# EAGLE schematic kicker (EAGLE 9.1.3)
DDRAWN: 08/12/18; FINISH: HASL; MATERIAL: FR-4; NDRAWN: WS; REV: 3.0; SCALE: 1:1; TITLE: SSL Kicker

## Sheet 1 of 8: Power Distribution
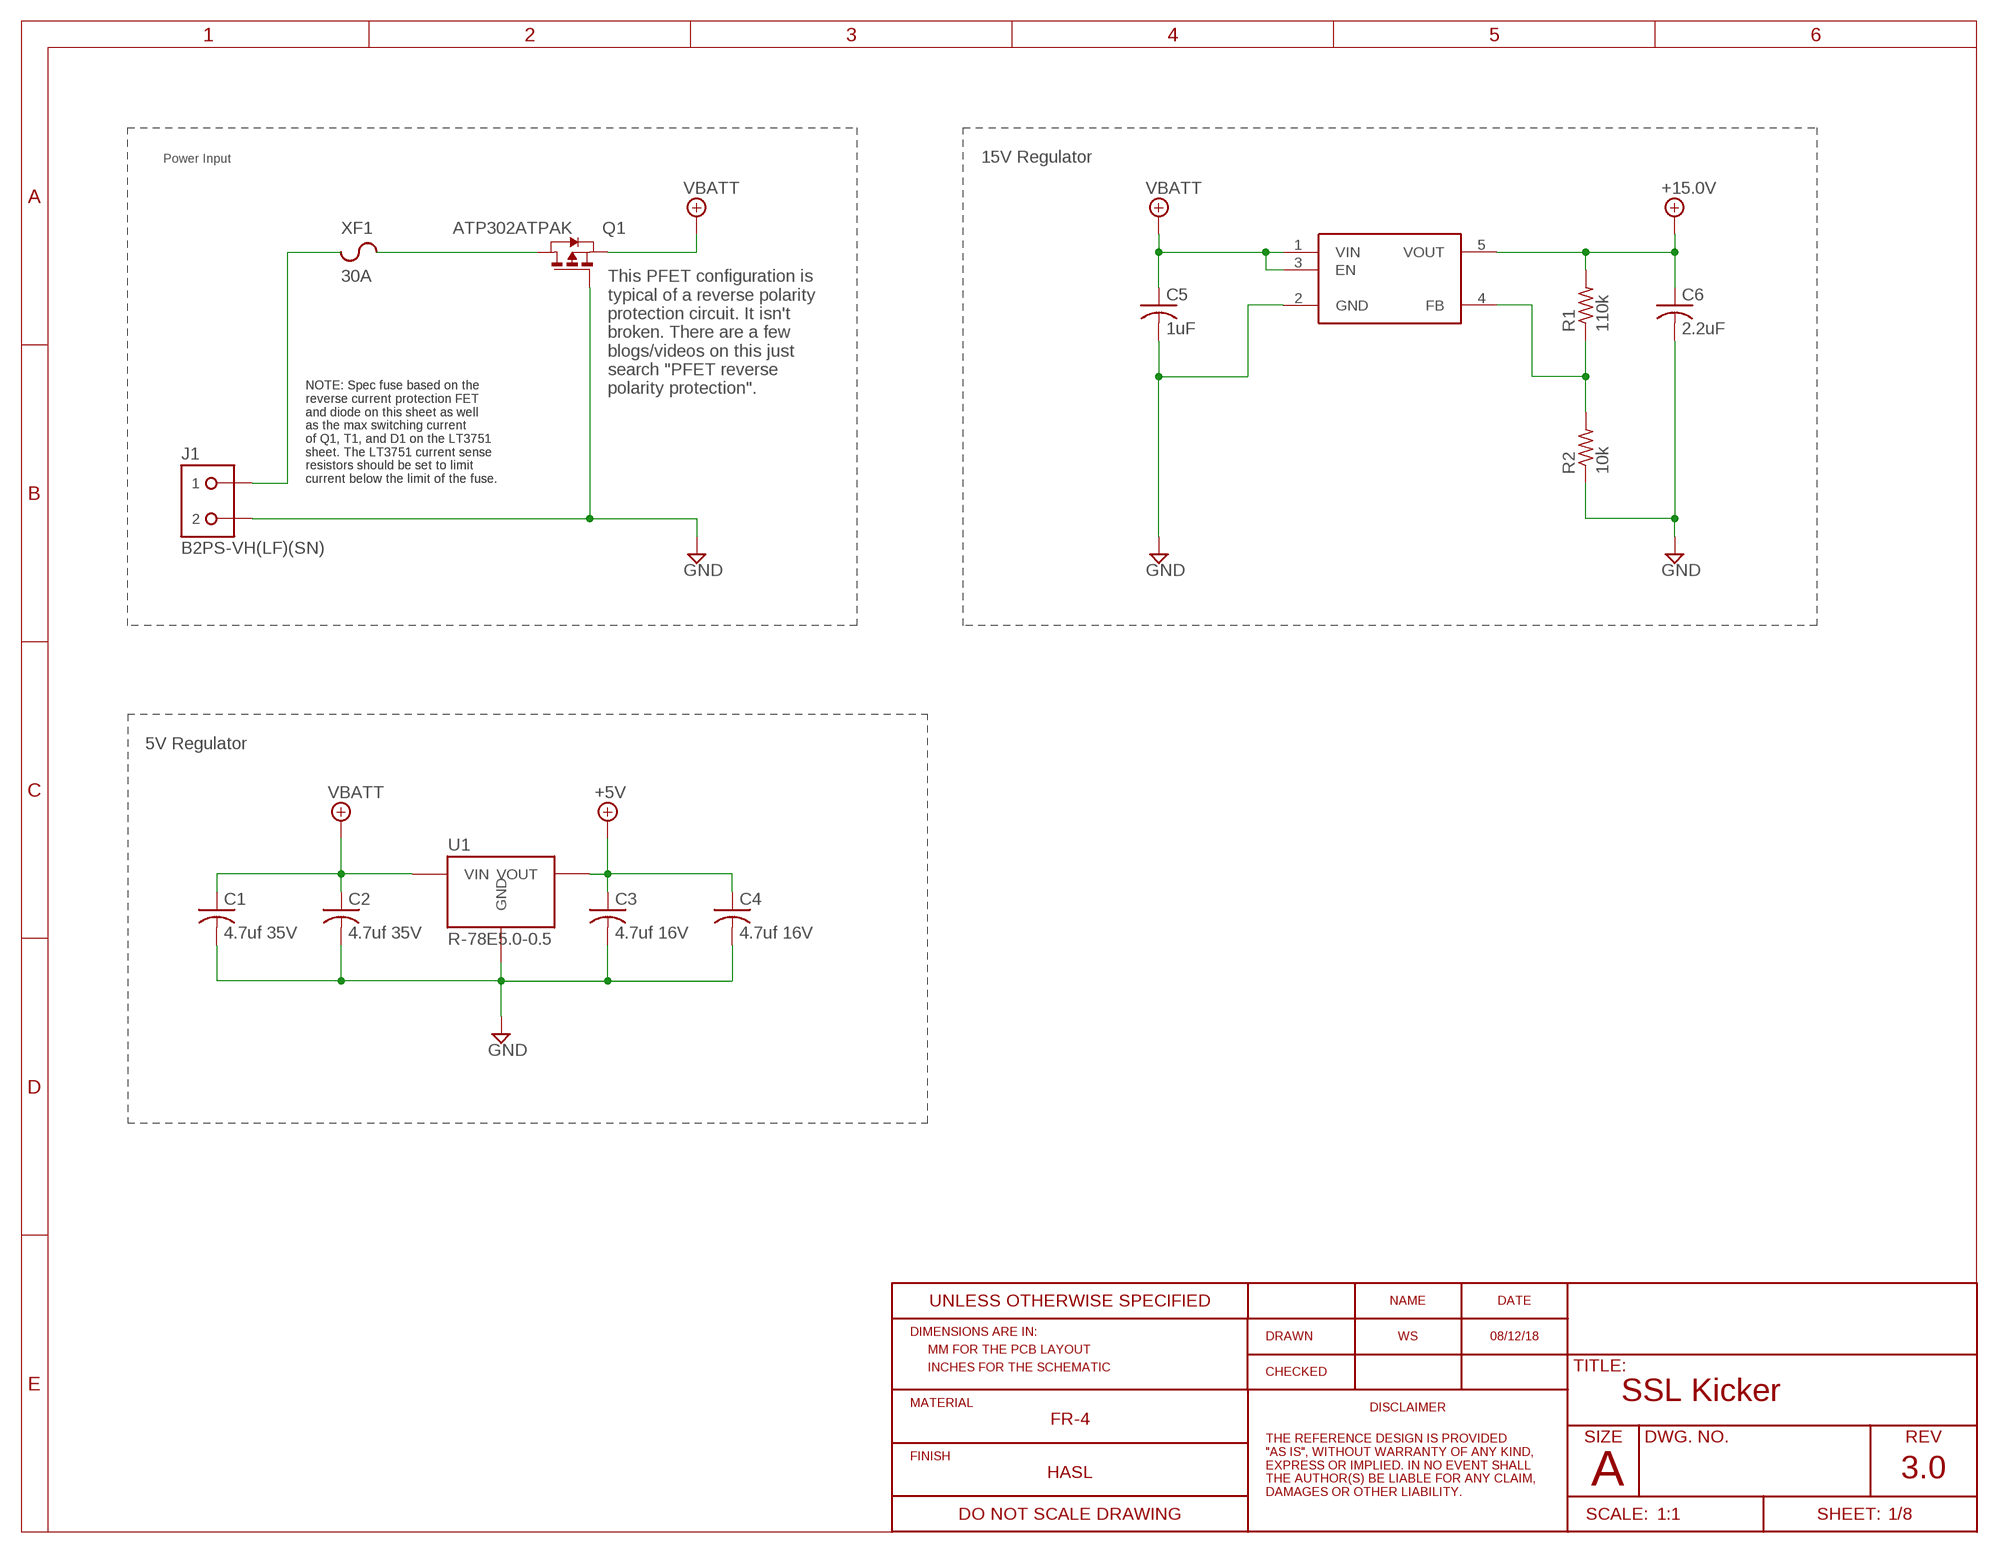
[diagram p0: schematic, sheet 1]

### Parts
C1  4.7uf 35V  C-USC1210  [C1210]
C2  4.7uf 35V  C-USC1210  [C1210]
C3  4.7uf 16V  C-USC1210  [C1210]
C4  4.7uf 16V  C-USC1210  [C1210]
C5  1uF  C-USC0603  [C0603]
C6  2.2uF  C-USC0603  [C0603]
J1  B2PS-VH(LF)(SN)  [B2PS-CENTERED]
Q1  ATP302ATPAK  [TO460P950X150-3]
R1  110k  R-US_R0603  [R0603]
R2  10k  R-US_R0603  [R0603]
U1  R-78E5.0-0.5  [R-78E]
U2  15V  MIC5235YM5SOT-23-5  [SOT95P280X145-5]
XF1  30A  3557-2  [3557-2]

### Nets
+5V: C3.1 C4.1 U1.3(VOUT) ; also sheet 3,5,6,7
+15.0V: C6.1 R1.2 U2.5(VOUT) ; also sheet 3,5
GND: C1.2 C2.2 C3.2 C4.2 C5.2 C6.2 J1.2 Q1.1(G) R2.1 U1.2(GND) U2.2(GND) ; also sheet 2,3,4,5,6,7
N$9: Q1.3(D) XF1.3 XF1.4
N$16: R1.1 R2.2 U2.4(FB)
N$39: J1.1 XF1.1 XF1.2
VBATT: C1.1 C2.1 C5.1 Q1.2(S) U1.1(VIN) U2.1(VIN) U2.3(EN) ; also sheet 2,4

### Notes on the sheet
- Power Input | 15V Regulator
- This PFET configuration is 
  typical of a reverse polarity 
  protection circuit. It isn't 
  broken. There are a few 
  blogs/videos on this just 
  search "PFET reverse 
  polarity protection".
- NOTE: Spec fuse based on the
  reverse current protection FET
  and diode on this sheet as well
  as the max switching current
  of Q1, T1, and D1 on the LT3751
  sheet. The LT3751 current sense
  resistors should be set to limit
  current below the limit of the fuse.
- NOTE: Spec fuse based on the
  reverse current protection FET
  and diode on this sheet as well
  as the max switching current
  of Q1, T1, and D1 on the LT3751
  sheet. The LT3751 current sense
  resistors should be set to limit
  current below the limit of the fuse.
- 5V Regulator

## Sheet 2 of 8: High Voltage Converter
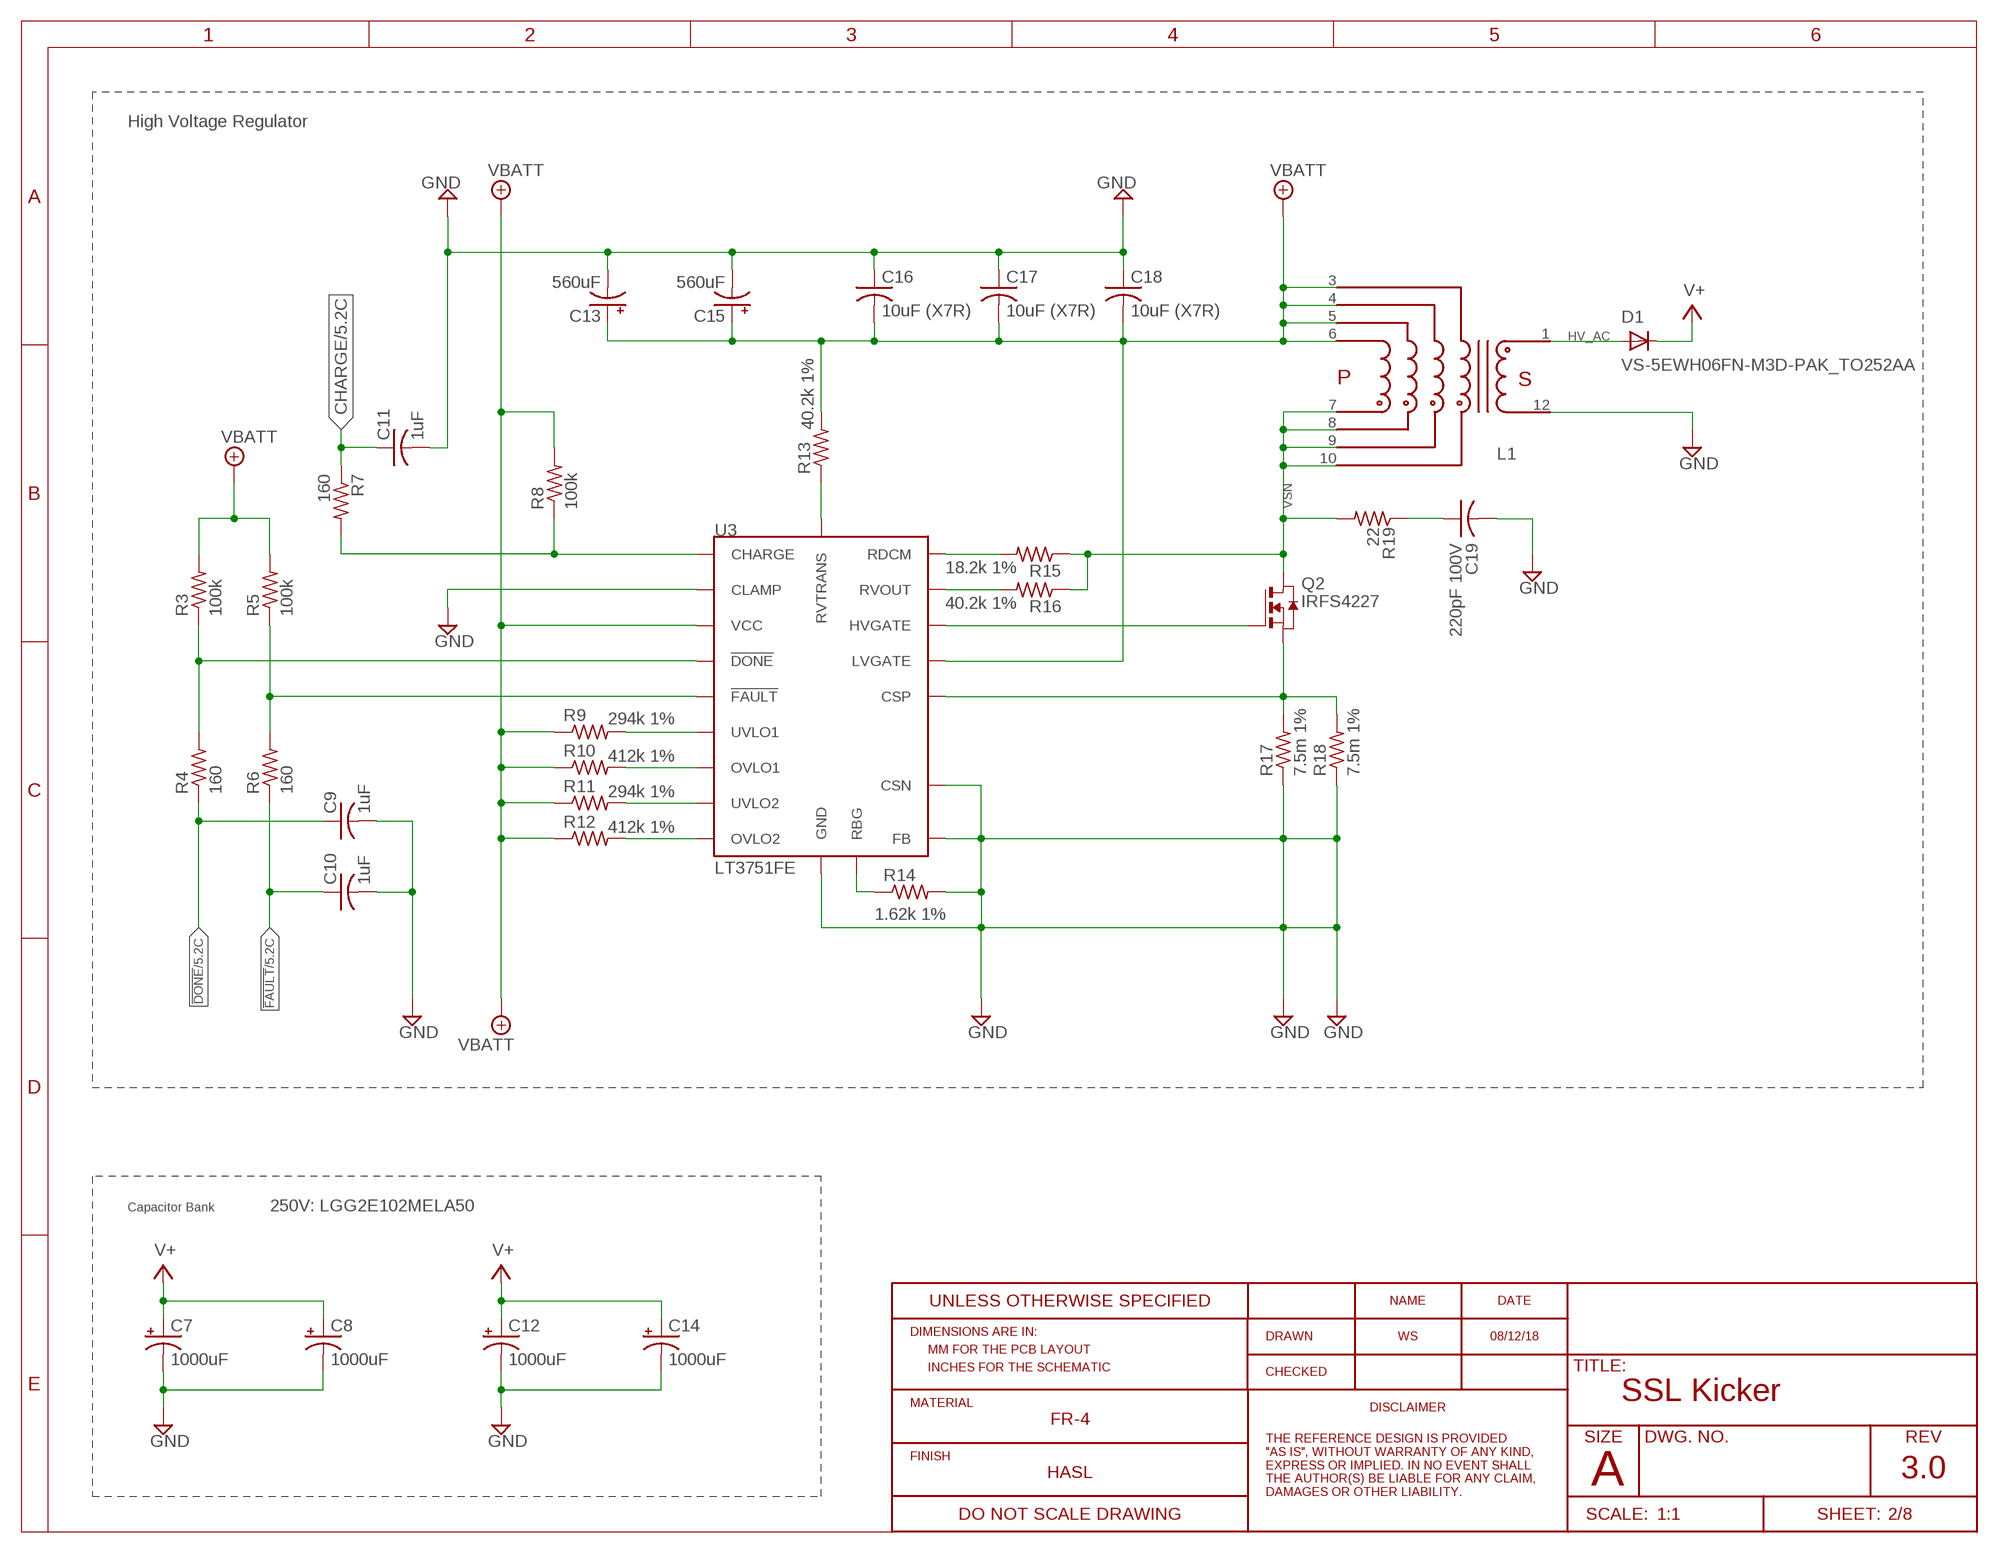
[diagram p1: schematic, sheet 2]

### Parts
C7  1000uF  CPOL-USE10-25  [EB25D]
C8  1000uF  CPOL-USE10-25  [EB25D]
C9  1uF  C-USC0603  [C0603]
C10  1uF  C-USC0603  [C0603]
C11  1uF  C-USC0603  [C0603]
C12  1000uF  CPOL-USE10-25  [EB25D]
C13  560uF  CPOL-USE7.5-18  [E7,5-18]
C14  1000uF  CPOL-USE10-25  [EB25D]
C15  560uF  CPOL-USE7.5-18  [E7,5-18]
C16  10uF (X7R)  C-USC1210  [C1210]
C17  10uF (X7R)  C-USC1210  [C1210]
C18  10uF (X7R)  C-USC1210  [C1210]
C19  220pF 100V  C-USC0603  [C0603]
D1  VS-5EWH06FN-M3D-PAK_TO252AA  [TO460P990X239-3]
L1  GA34XX-BLBL  [SOP400P3370X1400-12]
Q2  IRFS4227  [D2PAK]
R3  100k  R-US_R0603  [R0603]
R4  160  R-US_R0603  [R0603]
R5  100k  R-US_R0603  [R0603]
R6  160  R-US_R0603  [R0603]
R7  160  R-US_R0603  [R0603]
R8  100k  R-US_R0603  [R0603]
R9  294k 1%  R-US_R0805  [R0805]
R10  412k 1%  R-US_R0805  [R0805]
R11  294k 1%  R-US_R0805  [R0805]
R12  412k 1%  R-US_R0805  [R0805]
R13  40.2k 1%  R-US_R0805  [R0805]
R14  1.62k 1%  R-US_R0805  [R0805]
R15  18.2k 1%  R-US_R0805  [R0805]
R16  40.2k 1%  R-US_R0805  [R0805]
R17  7.5m 1%  R-US_R2512  [R2512]
R18  7.5m 1%  R-US_R2512  [R2512]
R19  22  R-US_R0805  [R0805]
U3  LT3751FE  [TSSOP-20_EP]

### Nets
!DONE!: C9.1 R4.1 ; also sheet 5
!DONE_LPF: R3.1 R4.2 U3.7(!DONE) ; also sheet 3
!FAULT!: C10.1 R6.1 ; also sheet 5
!FAULT_LPF: R5.1 R6.2 U3.6(!FAULT) ; also sheet 3
CHARGE: C11.1 R7.1 ; also sheet 5
CHARGE_LPF: R7.2 R8.1 U3.8(CHARGE)
GND: C7.- C8.- C9.2 C10.2 C11.2 C12.- C13.- C14.- C15.- C16.1 C17.1 C18.1 C19.2 L1.12 R14.2 R17.1 R18.1 U3.9(CLAMP) U3.10(FB) U3.11(CSN) U3.PAD(GND) ; also sheet 1,3,4,5,6,7
HV_AC: D1.2(A) L1.1
HVGATE: Q2.1(G) U3.15(HVGATE)
N$1: R14.1 U3.16(RBG)
N$24: R13.1 U3.1(RVTRANS)
N$32: C19.1 R19.1
OVLO1: R10.2 U3.3(OVLO1)
OVLO2: R12.2 U3.5(OVLO2)
RDCM: R15.2 U3.20(RDCM)
RVOUT: R16.2 U3.18(RVOUT)
SENSE: Q2.3(S) R17.2 R18.2 U3.12(CSP)
UVLO1: R9.2 U3.2(UVLO1)
UVLO2: R11.2 U3.4(UVLO2)
V+: C7.+ C8.+ C12.+ C14.+ D1.3(C) ; also sheet 3,4,5
VBATT: C13.+ C15.+ C16.2 C17.2 C18.2 L1.3 L1.4 L1.5 L1.6 R3.2 R5.2 R8.2 R9.1 R10.1 R11.1 R12.1 R13.2 U3.13(VCC) U3.14(LVGATE) ; also sheet 1,4
VSN: L1.7 L1.8 L1.9 L1.10 Q2.2(D) R15.1 R16.1 R19.2

### Notes on the sheet
- High Voltage Regulator
- Capacitor Bank | 250V: LGG2E102MELA50

## Sheet 3 of 8: LED Indicators
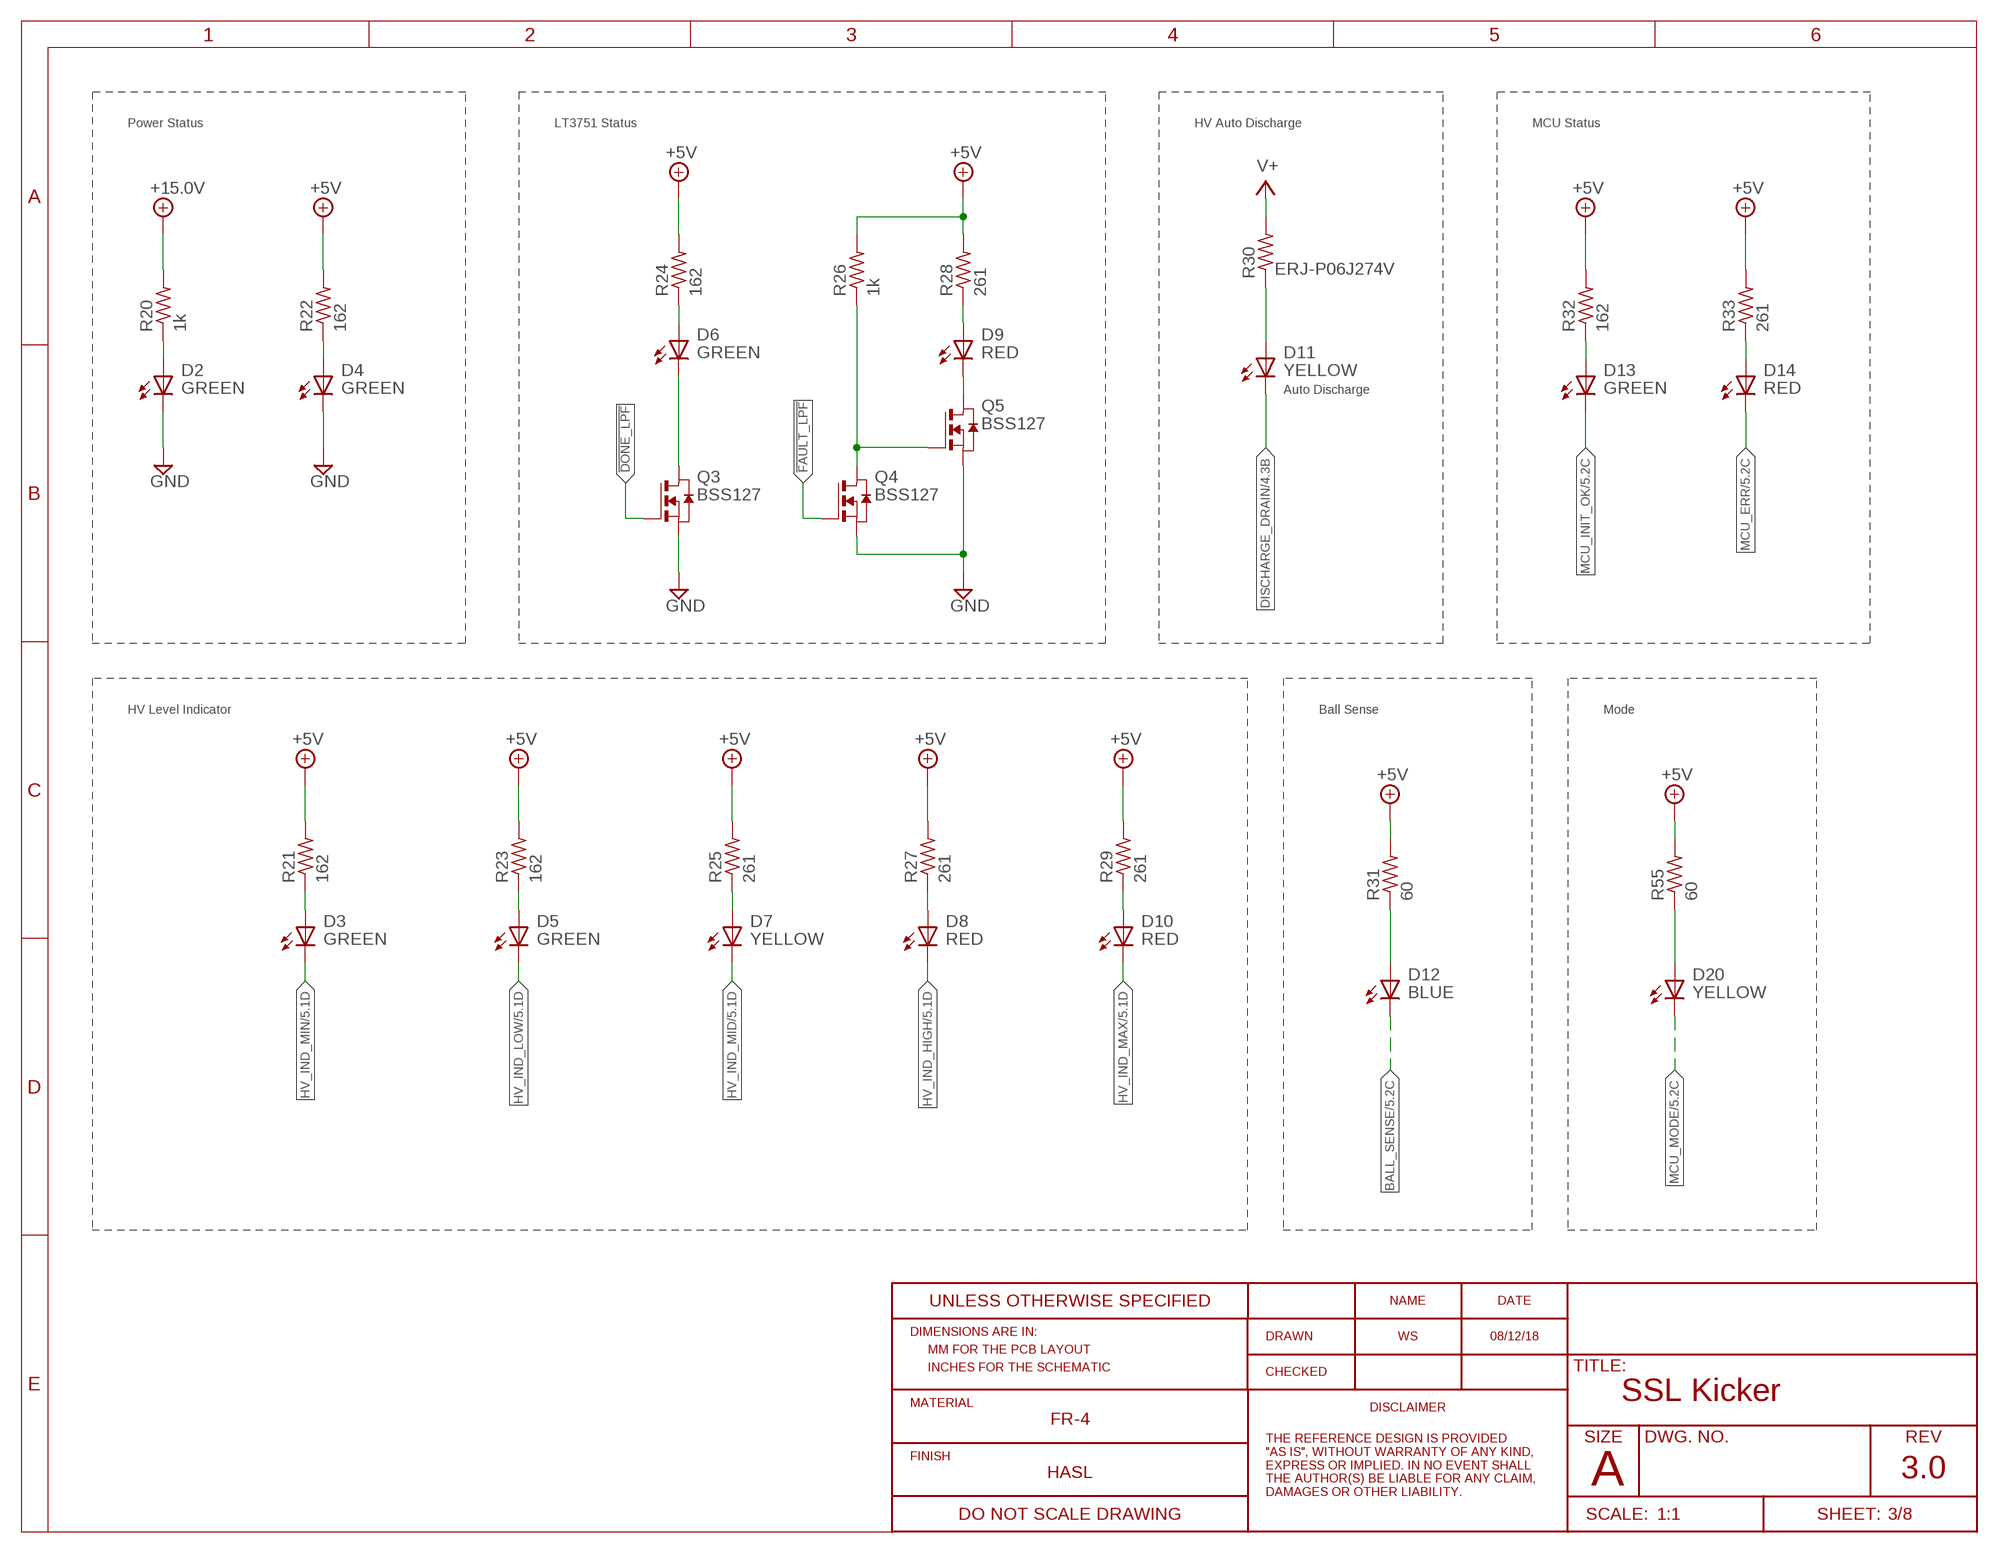
[diagram p2: schematic, sheet 3]

### Parts
D2  GREEN  LED-SMD-GREEN  [CHIP-LED0603]
D3  GREEN  LED-SMD-GREEN  [CHIP-LED0603]
D4  GREEN  LED-SMD-GREEN  [CHIP-LED0603]
D5  GREEN  LED-SMD-GREEN  [CHIP-LED0603]
D6  GREEN  LED-SMD-GREEN  [CHIP-LED0603]
D7  YELLOW  LED-SMD-YELLOW  [CHIP-LED0603]
D8  RED  LED-SMD-RED  [CHIP-LED0603]
D9  RED  LED-SMD-RED  [CHIP-LED0603]
D10  RED  LED-SMD-RED  [CHIP-LED0603]
D11  YELLOW  LED-SMD-YELLOW  [CHIP-LED0603]
D12  BLUE  LED-SMD-BLUE  [CHIP-LED0603]
D13  GREEN  LED-SMD-GREEN  [CHIP-LED0603]
D14  RED  LED-SMD-RED  [CHIP-LED0603]
D20  YELLOW  LED-SMD-YELLOW  [CHIP-LED0603]
Q3  BSS127  [SOT-23-3]
Q4  BSS127  [SOT-23-3]
Q5  BSS127  [SOT-23-3]
R20  1k  R-US_R0603  [R0603]
R21  162  R-US_R0603  [R0603]
R22  162  R-US_R0603  [R0603]
R23  162  R-US_R0603  [R0603]
R24  162  R-US_R0603  [R0603]
R25  261  R-US_R0603  [R0603]
R26  1k  R-US_R0603  [R0603]
R27  261  R-US_R0603  [R0603]
R28  261  R-US_R0603  [R0603]
R29  261  R-US_R0603  [R0603]
R30  ERJ-P06J274V  R-US_R0805  [R0805]
R31  60  R-US_R0603  [R0603]
R32  162  R-US_R0603  [R0603]
R33  261  R-US_R0603  [R0603]
R55  60  R-US_R0603  [R0603]

### Nets
!DONE_LPF: Q3.1(G) ; also sheet 2
!FAULT_LPF: Q4.1(G) ; also sheet 2
+5V: R21.2 R22.2 R23.2 R24.2 R25.2 R26.2 R27.2 R28.2 R29.2 R31.2 R32.2 R33.2 R55.2 ; also sheet 1,5,6,7
+15.0V: R20.2 ; also sheet 1,5
BALL_SENSE: D12.C(K) ; also sheet 5
DISCHARGE_DRAIN: D11.C(K) ; also sheet 4
GND: D2.C(K) D4.C(K) Q3.2(S) Q4.2(S) Q5.2(S) ; also sheet 1,2,4,5,6,7
HV_IND_HIGH: D8.C(K) ; also sheet 5
HV_IND_LOW: D5.C(K) ; also sheet 5
HV_IND_MAX: D10.C(K) ; also sheet 5
HV_IND_MID: D7.C(K) ; also sheet 5
HV_IND_MIN: D3.C(K) ; also sheet 5
MCU_ERR: D14.C(K) ; also sheet 5
MCU_INIT_OK: D13.C(K) ; also sheet 5
MCU_MODE: D20.C(K) ; also sheet 5
N$3: D14.A R33.1
N$4: D13.A R32.1
N$5: D6.A R24.1
N$11: D3.A R21.1
N$12: D5.A R23.1
N$13: D7.A R25.1
N$17: D20.A R55.1
N$20: D4.A R22.1
N$21: D8.A R27.1
N$22: D2.A R20.1
N$26: Q4.3(D) Q5.1(G) R26.1
N$27: D9.A R28.1
N$28: D9.C(K) Q5.3(D)
N$29: D11.A R30.1
N$30: D10.A R29.1
N$37: D6.C(K) Q3.3(D)
N$40: D12.A R31.1
V+: R30.2 ; also sheet 2,4,5

### Notes on the sheet
- Power Status | LT3751 Status | HV Auto Discharge | MCU Status
- Auto Discharge
- HV Level Indicator | Ball Sense | Mode

## Sheet 4 of 8: Auto Quick Discharge
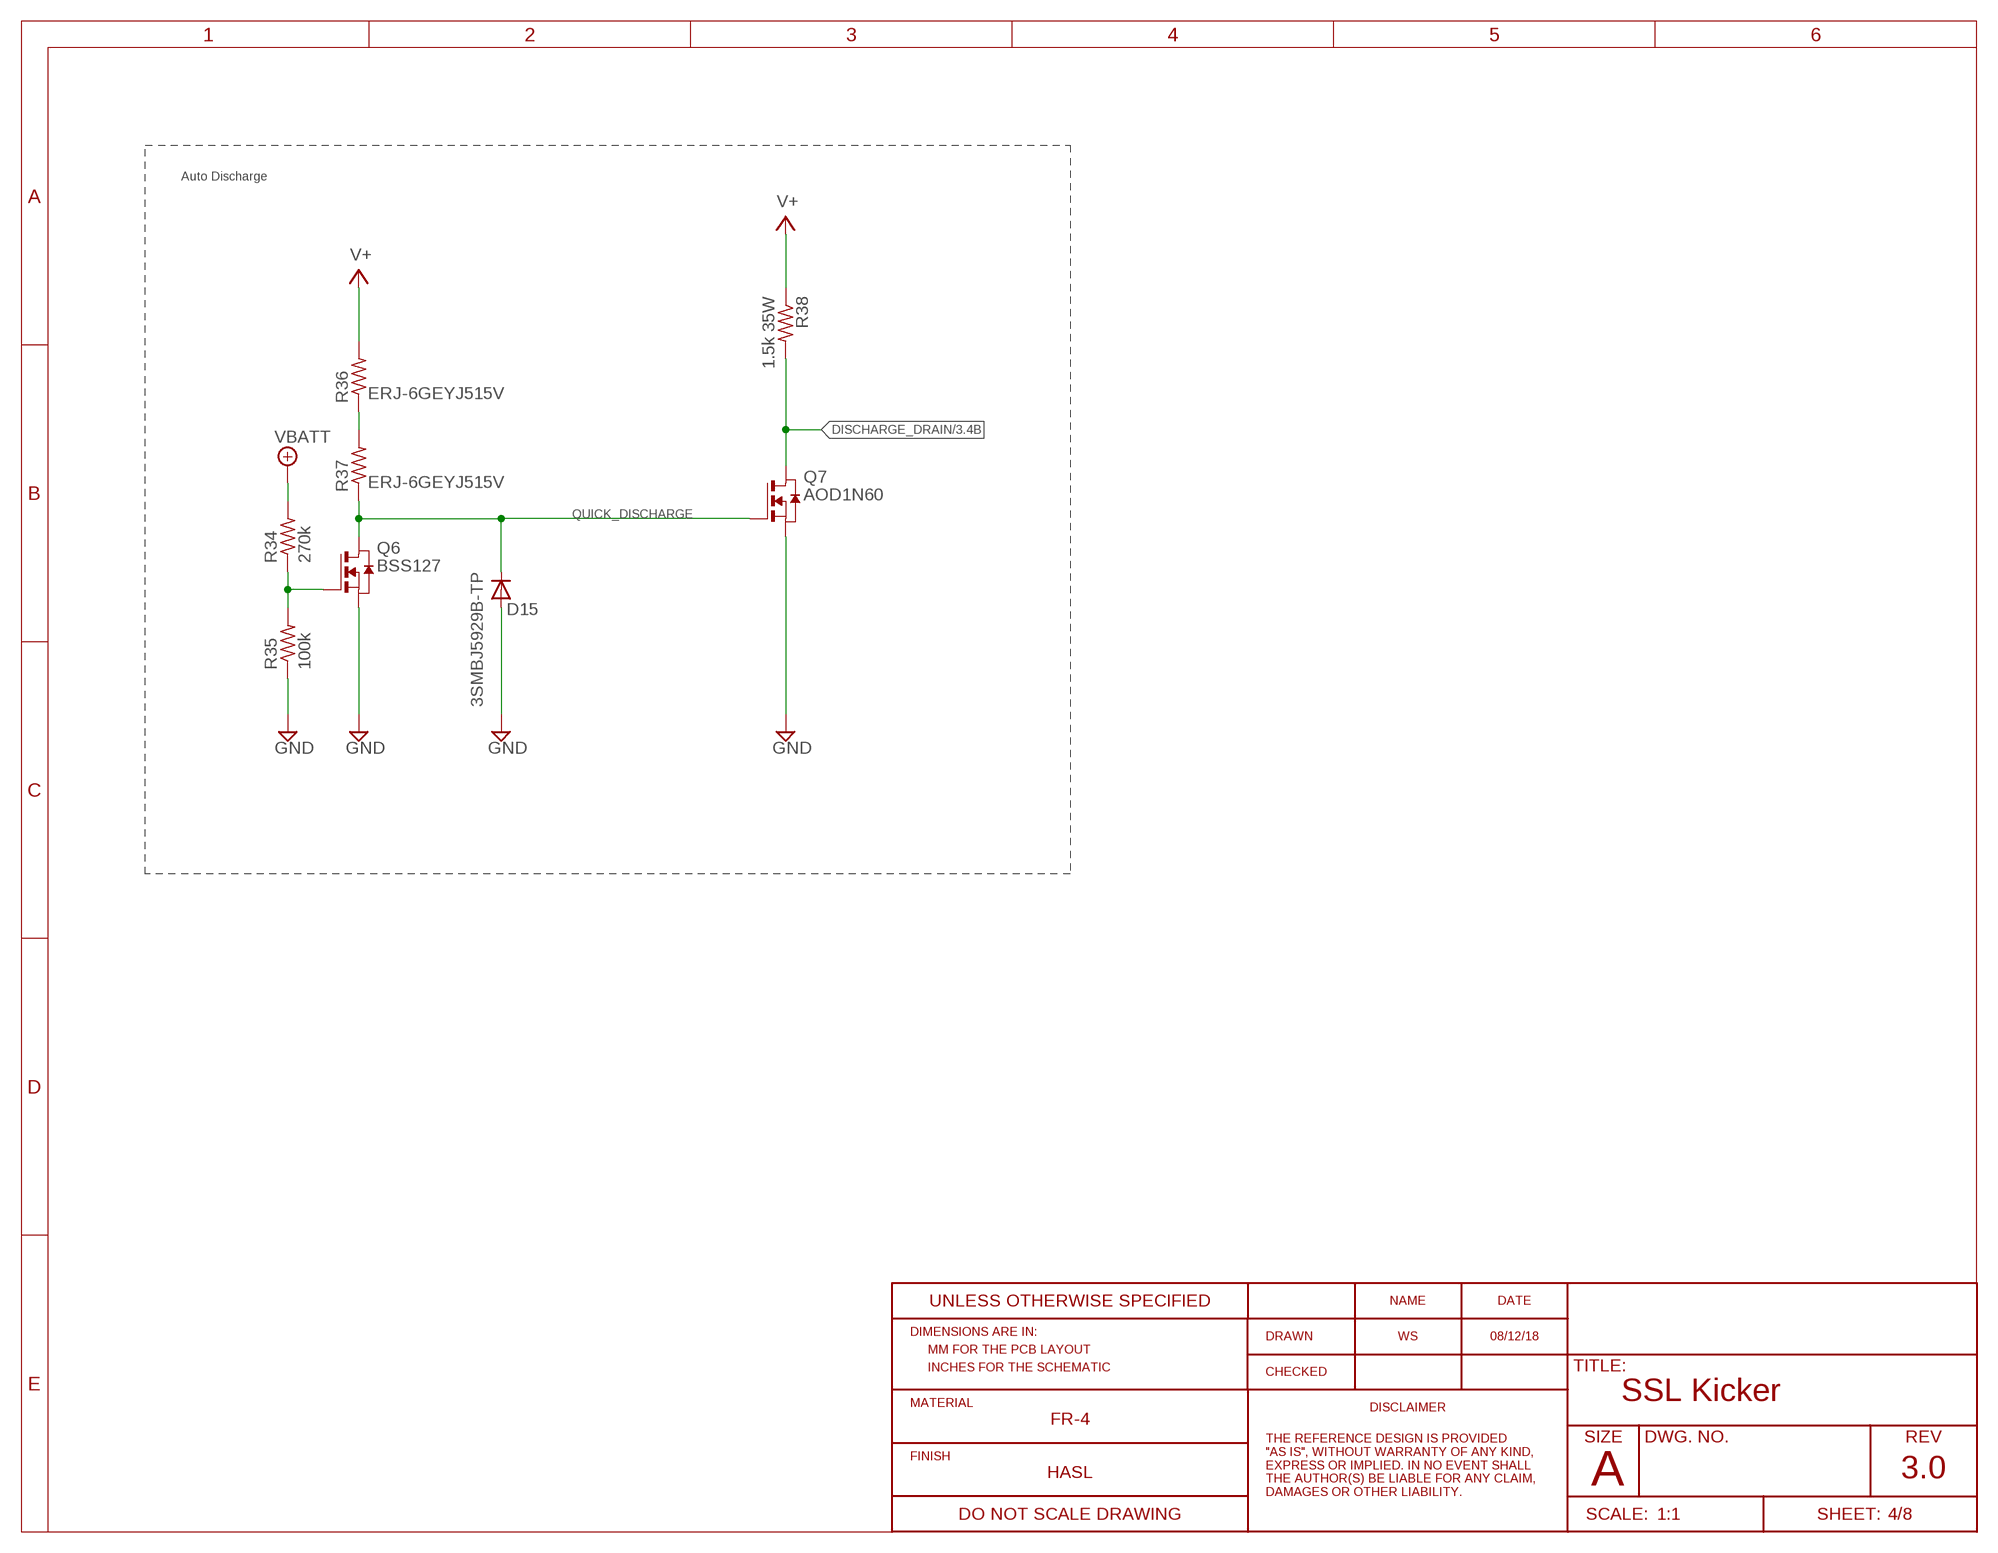
[diagram p3: schematic, sheet 4]

### Parts
D15  3SMBJ5929B-TP  DIODE-DO214AA  [DO214AA]
Q6  BSS127  [SOT-23-3]
Q7  AOD1N60  [DPAK]
R34  270k  R-US_R0603  [R0603]
R35  100k  R-US_R0603  [R0603]
R36  ERJ-6GEYJ515V  R-US_R0805  [R0805]
R37  ERJ-6GEYJ515V  R-US_R0805  [R0805]
R38  1.5k 35W  PWR263S-35TO-263AB  [TO508P1539X450-3]

### Nets
DISCHARGE_DRAIN: Q7.FIN(D) R38.2(PIN2) ; also sheet 3
GND: D15.A Q6.2(S) Q7.3(S) R35.1 ; also sheet 1,2,3,5,6,7
N$2: R36.1 R37.2
N$10: Q6.1(G) R34.1 R35.2
QUICK_DISCHARGE: D15.C Q6.3(D) Q7.1(G) R37.1
V+: R36.2 R38.1(PIN1) ; also sheet 2,3,5
VBATT: R34.2 ; also sheet 1,2

### Notes on the sheet
- Auto Discharge

## Sheet 5 of 8: MCU
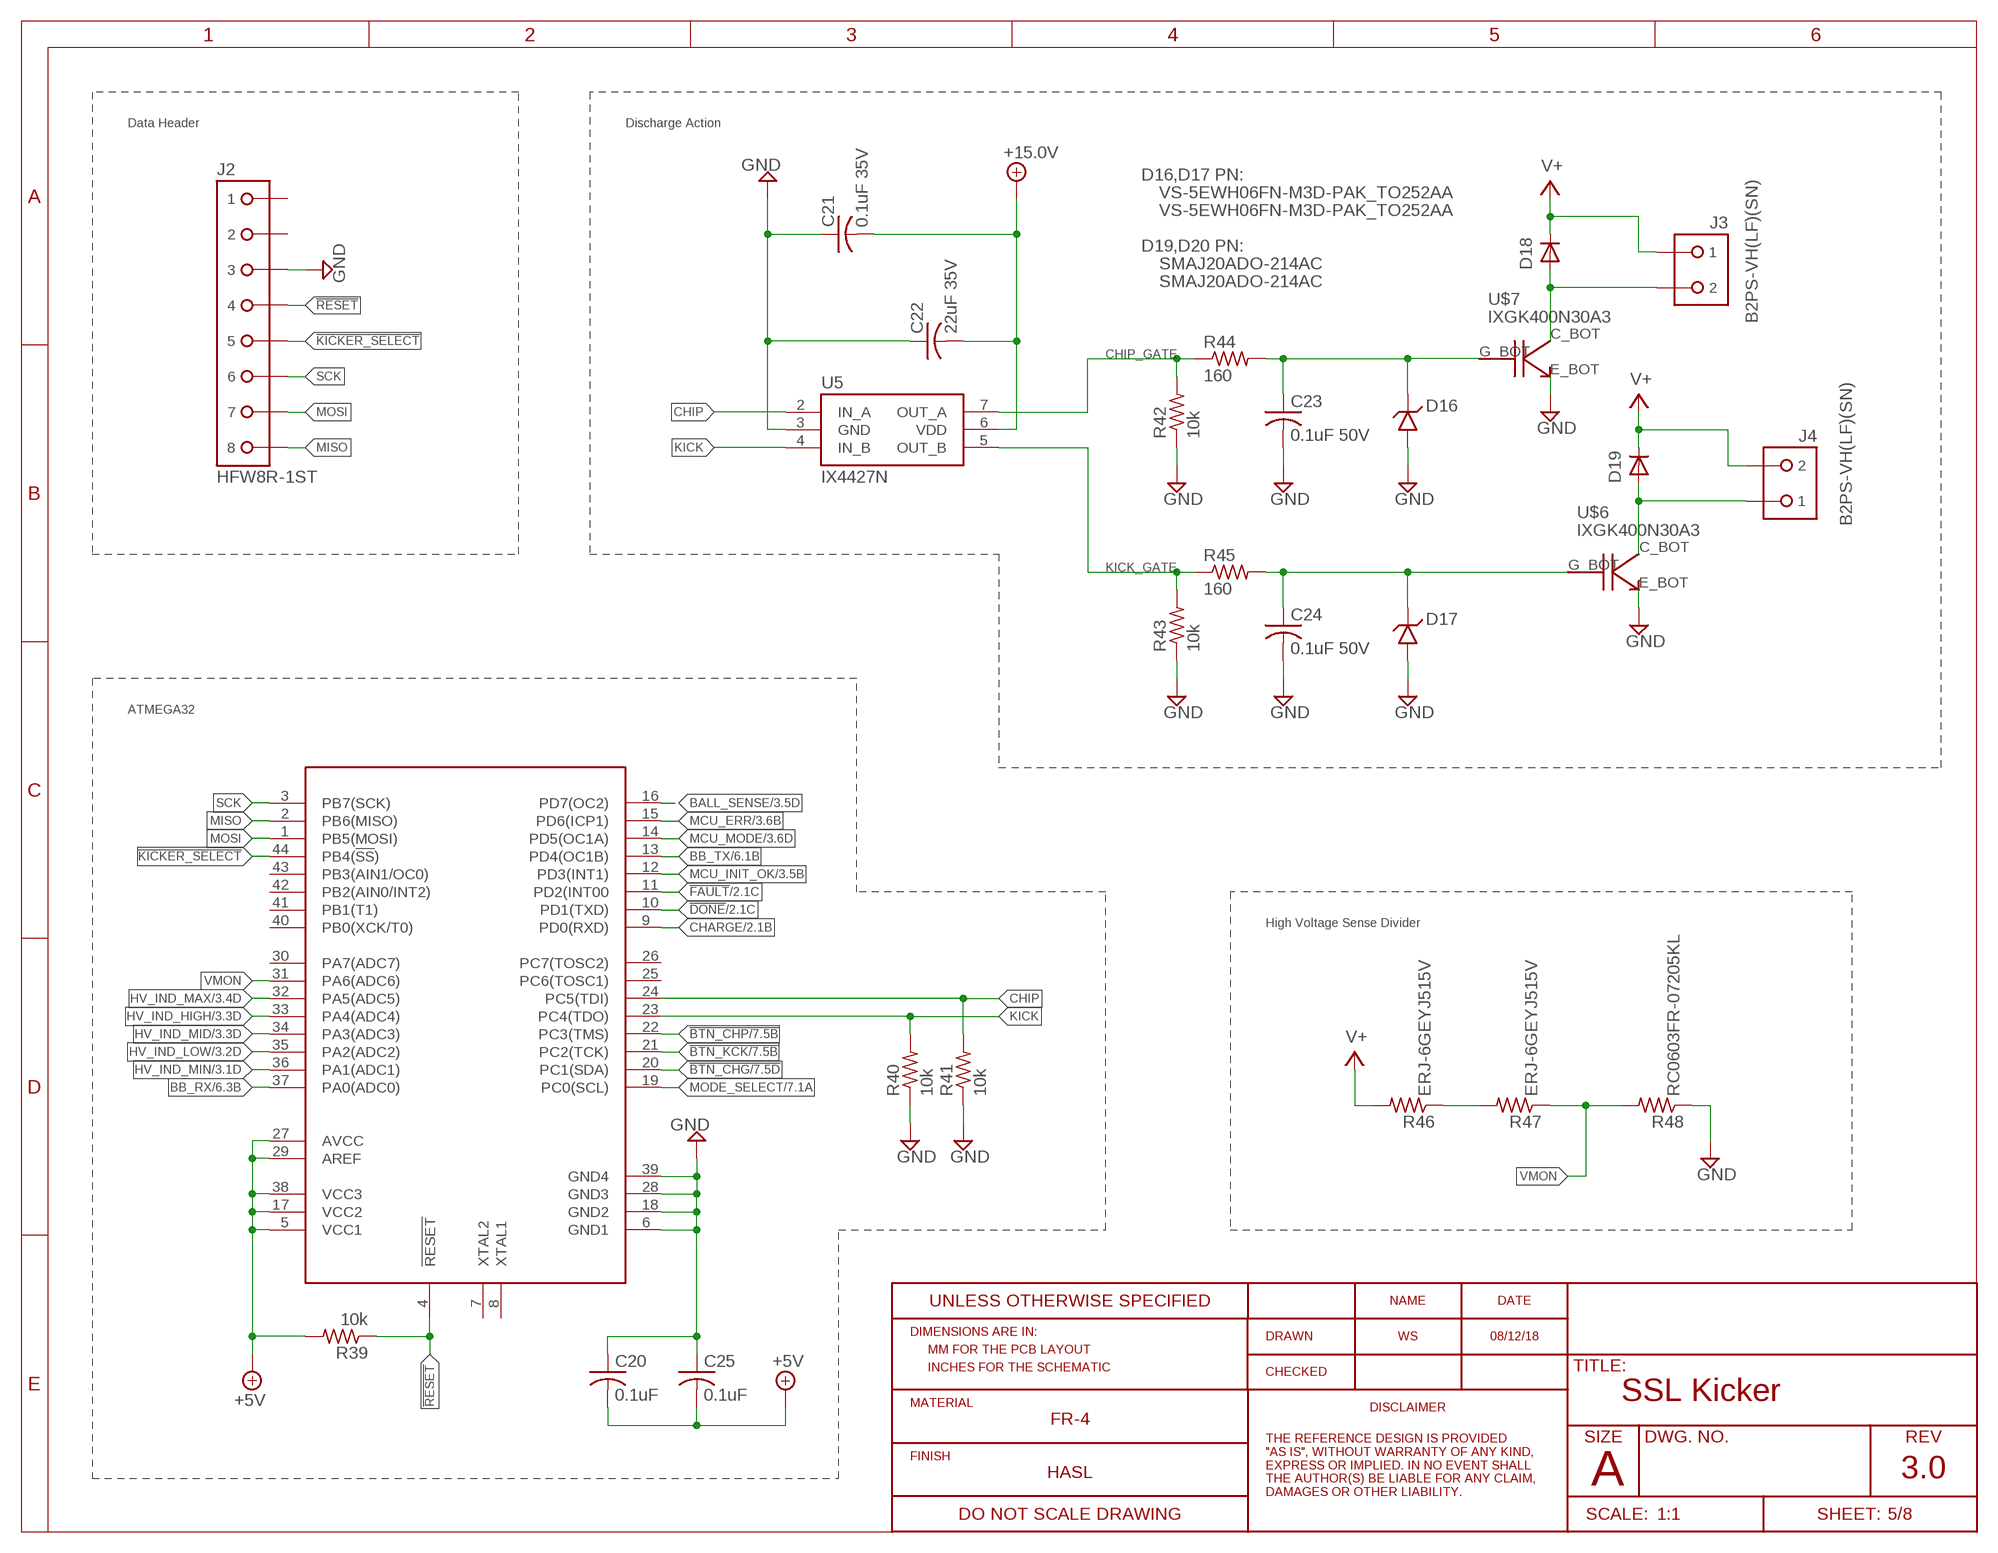
[diagram p4: schematic, sheet 5]

### Parts
C20  0.1uF  C-USC0603  [C0603]
C21  0.1uF 35V  C-USC0603  [C0603]
C22  22uF 35V  C-USC0805  [C0805]
C23  0.1uF 50V  C-USC0603  [C0603]
C24  0.1uF 50V  C-USC0603  [C0603]
C25  0.1uF  C-USC0603  [C0603]
D16  SMAJ20ADO-214AC  [RESM5226X262]
D17  SMAJ20ADO-214AC  [RESM5226X262]
D18  VS-5EWH06FN-M3D-PAK_TO252AA  [TO460P990X239-3]
D19  VS-5EWH06FN-M3D-PAK_TO252AA  [TO460P990X239-3]
J2  HFW8R-1ST  [HFW8R-1ST]
J3  B2PS-VH(LF)(SN)  [B2PS-CENTERED]
J4  B2PS-VH(LF)(SN)  [B2PS-CENTERED]
R39  10k  R-US_R0603  [R0603]
R40  10k  R-US_R0603  [R0603]
R41  10k  R-US_R0603  [R0603]
R42  10k  R-US_R0603  [R0603]
R43  10k  R-US_R0603  [R0603]
R44  160  R-US_R1206  [R1206]
R45  160  R-US_R1206  [R1206]
R46  ERJ-6GEYJ515V  R-US_R0805  [R0805]
R47  ERJ-6GEYJ515V  R-US_R0805  [R0805]
R48  RC0603FR-07205KL  R-US_R0603  [R0603]
U4  AT32ATQFP44  [QFP80P1200X1200X120-44]
U5  IX4427N  [SOIC-8]
U$6  IXGK400N30A3  [TO264]
U$7  IXGK400N30A3  [TO264]

### Nets
!BTN_CHG: U4.20(PC1(SDA)) ; also sheet 7
!BTN_CHP: U4.22(PC3(TMS)) ; also sheet 7
!BTN_KCK: U4.21(PC2(TCK)) ; also sheet 7
!DONE!: U4.10(PD1(TXD)) ; also sheet 2
!FAULT!: U4.11(PD2(INT00) ; also sheet 2
!KICKER_SELECT: J2.5 U4.44(PB4(!SS!))
!RESET: J2.4 R39.1 U4.4(!RESET!)
+5V: C20.2 C25.2 R39.2 U4.5(VCC1) U4.17(VCC2) U4.27(AVCC) U4.29(AREF) U4.38(VCC3) ; also sheet 1,3,6,7
+15.0V: C21.2 C22.2 U5.6(VDD) ; also sheet 1,3
BALL_SENSE: U4.16(PD7(OC2)) ; also sheet 3
BB_RX: U4.37(PA0(ADC0)) ; also sheet 6
BB_TX: U4.13(PD4(OC1B)) ; also sheet 6
CHARGE: U4.9(PD0(RXD)) ; also sheet 2
CHIP: R41.2 U4.24(PC5(TDI)) U5.2(IN_A)
CHIP_GATE: R42.2 R44.1 U5.7(OUT_A)
CHIPPER: D18.2(A) J3.2 U$7.C_BOT(C)
GND: C20.1 C21.1 C22.1 C23.2 C24.2 C25.1 D16.1(A) D17.1(A) J2.3 R40.1 R41.1 R42.1 R43.1 R48.1 U4.6(GND1) U4.18(GND2) U4.28(GND3) U4.39(GND4) U5.3(GND) U$6.E_BOT(E) U$7.E_BOT(E) ; also sheet 1,2,3,4,6,7
HV_IND_HIGH: U4.33(PA4(ADC4)) ; also sheet 3
HV_IND_LOW: U4.35(PA2(ADC2)) ; also sheet 3
HV_IND_MAX: U4.32(PA5(ADC5)) ; also sheet 3
HV_IND_MID: U4.34(PA3(ADC3)) ; also sheet 3
HV_IND_MIN: U4.36(PA1(ADC1)) ; also sheet 3
KICK: R40.2 U4.23(PC4(TDO)) U5.4(IN_B)
KICK_GATE: R43.2 R45.1 U5.5(OUT_B)
KICKER: D19.2(A) J4.1 U$6.C_BOT(C)
MCU_ERR: U4.15(PD6(ICP1)) ; also sheet 3
MCU_INIT_OK: U4.12(PD3(INT1)) ; also sheet 3
MCU_MODE: U4.14(PD5(OC1A)) ; also sheet 3
MISO: J2.8 U4.2(PB6(MISO))
MODE_SELECT: U4.19(PC0(SCL)) ; also sheet 7
MOSI: J2.7 U4.1(PB5(MOSI))
N$7: C23.1 D16.2(C) R44.2 U$7.G_BOT(G)
N$8: C24.1 D17.2(C) R45.2 U$6.G_BOT(G)
N$15: R46.1 R47.2
SCK: J2.6 U4.3(PB7(SCK))
V+: D18.3(C) D19.3(C) J3.1 J4.2 R46.2 ; also sheet 2,3,4
VMON: R47.1 R48.2 U4.31(PA6(ADC6))
Unconnected: J2.1 J2.2 J2.LEG1 J2.LEG2 U4.7(XTAL2) U4.8(XTAL1) U4.25(PC6(TOSC1)) U4.26(PC7(TOSC2)) U4.30(PA7(ADC7)) U4.40(PB0(XCK/T0)) U4.41(PB1(T1)) U4.42(PB2(AIN0/INT2)) U4.43(PB3(AIN1/OC0))

### Notes on the sheet
- Data Header | Discharge Action
- D16,D17 PN:
- VS-5EWH06FN-M3D-PAK_TO252AA
- VS-5EWH06FN-M3D-PAK_TO252AA
- D19,D20 PN:
- SMAJ20ADO-214AC
- SMAJ20ADO-214AC
- ATMEGA32
- High Voltage Sense Divider

## Sheet 6 of 8: Breakbeam
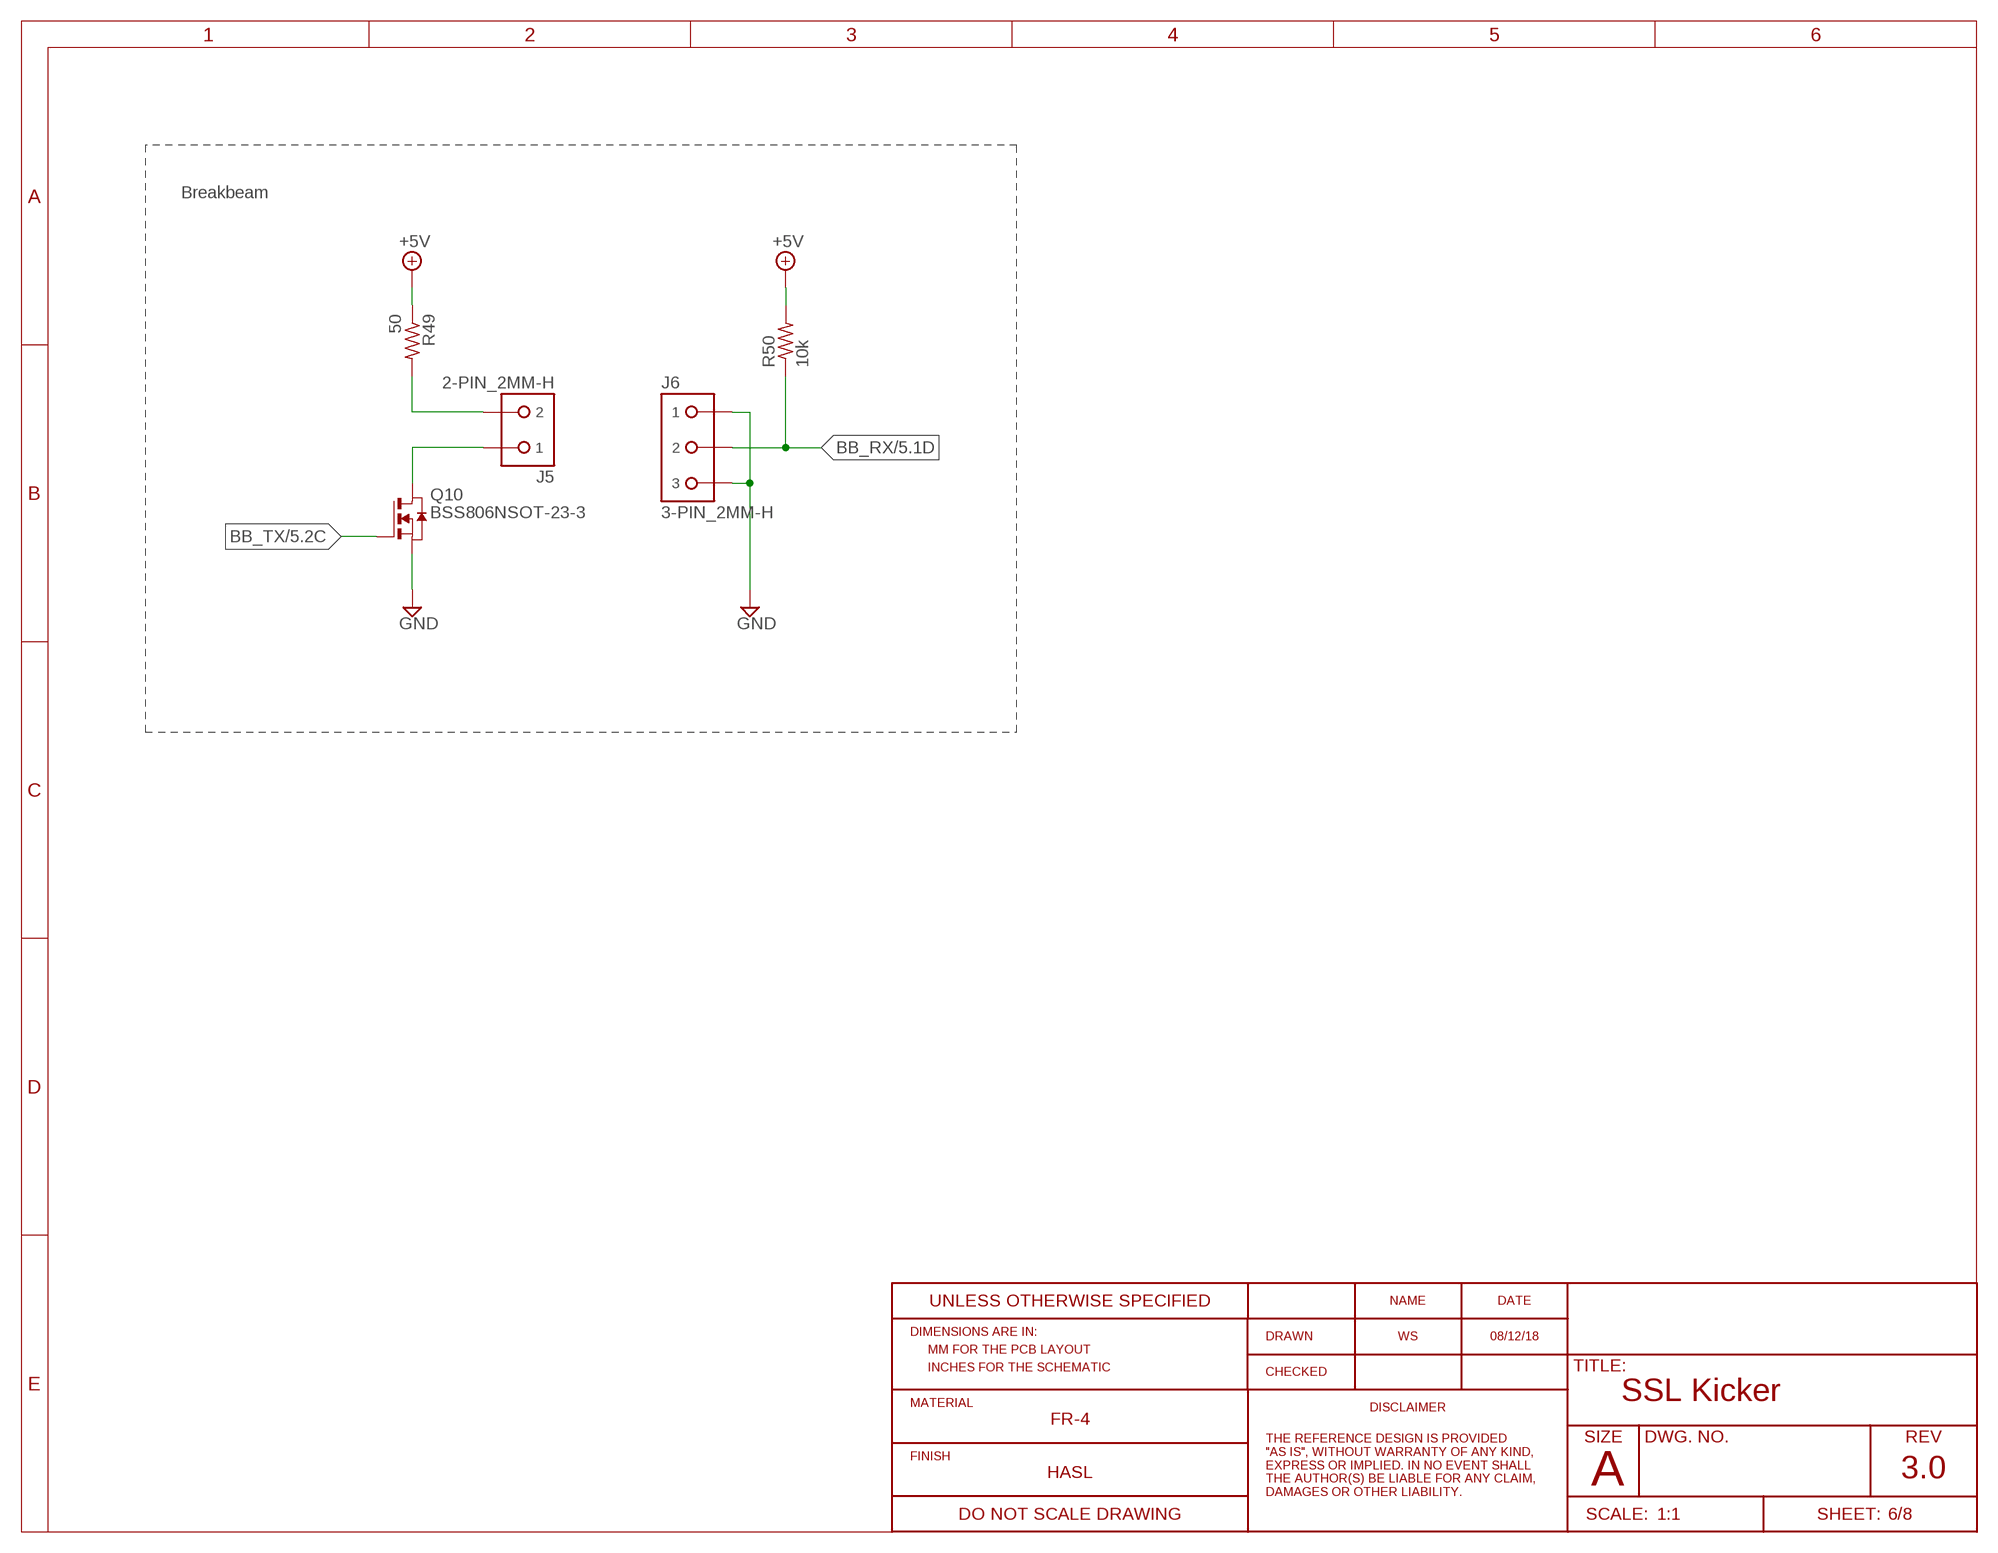
[diagram p5: schematic, sheet 6]

### Parts
J5  2-PIN_2MM-H  [2MM-2-H]
J6  3-PIN_2MM-H  [2MM-3-H]
Q10  BSS806NSOT-23-3  [SOT95P240X110-3]
R49  50  R-US_R0603  [R0603]
R50  10k  R-US_R0603  [R0603]

### Nets
+5V: R49.1 R50.2 ; also sheet 1,3,5,7
BB_RX: J6.2 R50.1 ; also sheet 5
BB_TX: Q10.1(G) ; also sheet 5
GND: J6.1 J6.3 Q10.2(S) ; also sheet 1,2,3,4,5,7
N$6: J5.2 R49.2
N$19: J5.1 Q10.3(D)

### Notes on the sheet
- Breakbeam

## Sheet 7 of 8: User Input
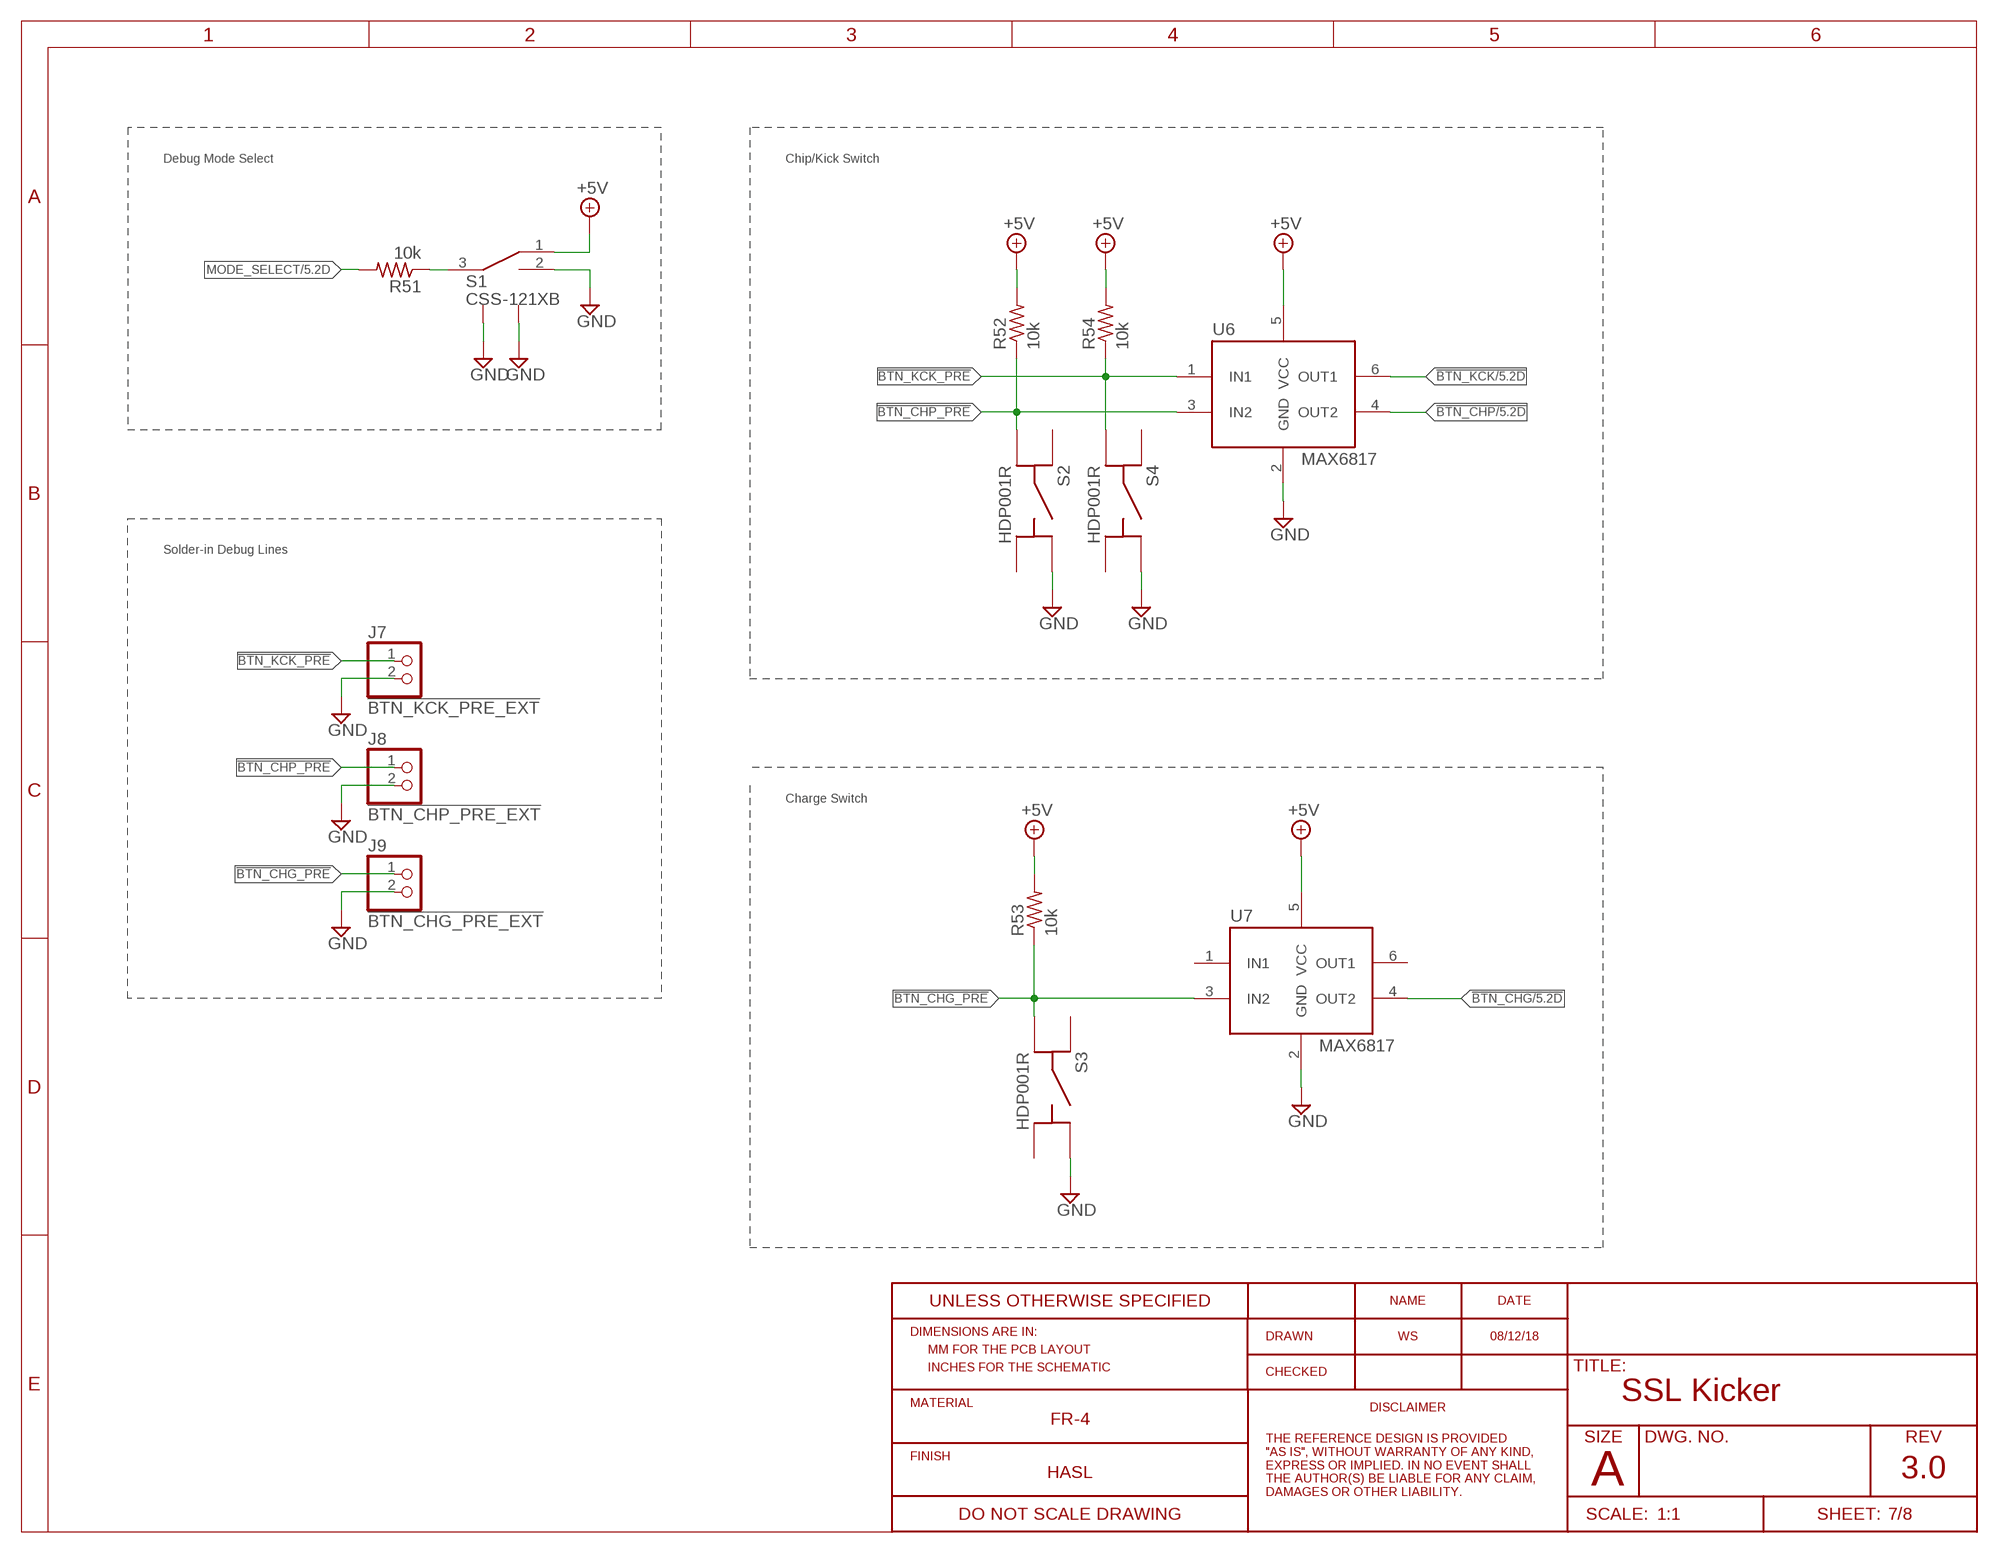
[diagram p6: schematic, sheet 7]

### Parts
J7  !BTN_KCK_PRE_EXT  CONN-2VERT  [1X2]
J8  !BTN_CHP_PRE_EXT  CONN-2VERT  [1X2]
J9  !BTN_CHG_PRE_EXT  CONN-2VERT  [1X2]
R51  10k  R-US_R0603  [R0603]
R52  10k  R-US_R0603  [R0603]
R53  10k  R-US_R0603  [R0603]
R54  10k  R-US_R0603  [R0603]
S1  CSS-121XB  [CSS-121XB]
S2  HDP001R  [HDP001R]
S3  HDP001R  [HDP001R]
S4  HDP001R  [HDP001R]
U6  MAX6817  [SOT-23-6]
U7  MAX6817  [SOT-23-6]

### Nets
!BTN_CHG: U7.4(OUT2) ; also sheet 5
!BTN_CHG_PRE: J9.1 R53.1 S3.C(A2) U7.3(IN2)
!BTN_CHP: U6.4(OUT2) ; also sheet 5
!BTN_CHP_PRE: J8.1 R52.1 S2.C(A2) U6.3(IN2)
!BTN_KCK: U6.6(OUT1) ; also sheet 5
!BTN_KCK_PRE: J7.1 R54.1 S4.C(A2) U6.1(IN1)
+5V: R52.2 R53.2 R54.2 S1.1(A) U6.5(VCC) U7.5(VCC) ; also sheet 1,3,5,6
GND: J7.2 J8.2 J9.2 S1.2(B) S1.LEG1 S1.LEG4(LEG2) S2.B(B1) S3.B(B1) S4.B(B1) U6.2(GND) U7.2(GND) ; also sheet 1,2,3,4,5,6
MODE_SELECT: R51.2 ; also sheet 5
N$14: R51.1 S1.3(COMMON)
Unconnected: S2.A(A1) S2.D(B2) S3.A(A1) S3.D(B2) S4.A(A1) S4.D(B2) U7.1(IN1) U7.6(OUT1)

### Notes on the sheet
- Debug Mode Select | Chip/Kick Switch
- Solder-in Debug Lines
- Charge Switch

## Sheet 8 of 8

## Library data of the parts
C1-C6 C16-C18 = rcl:C-US: CAPACITOR, American symbol; SPICEPREFIX: C
C7 C8 C12-C15 = rcl:CPOL-US: POLARIZED CAPACITOR, American symbol; SPICEPREFIX: C
C9-C11 C19-C25 = rcl:C-US: CAPACITOR, American symbol
D1 D18 D19 = RoboJackets-Diodes:VS-5EWH06FN-M3
D2-D6 D13 = RoboJackets-LEDs:LED-SMD; DIGIKEY: 160-1446-1-ND; MPN: LTST-C191KGKT
D7 D11 D20 = RoboJackets-LEDs:LED-SMD; DIGIKEY: 160-1448-1-ND; MPN: LTST-C191KSKT
D8-D10 D14 = RoboJackets-LEDs:LED-SMD; DIGIKEY: 160-1447-1-ND; MPN: LTST-C191KRKT
D12 = RoboJackets-LEDs:LED-SMD; DIGIKEY: 160-1647-1-ND; MPN: LTST-C191TBKT
D15 = RoboJackets-Diodes:DIODE-: DIODE
D16 D17 = RoboJackets-Diodes:SMAJ20A
J1 J3 J4 = RoboJackets-Connectors:B2P?-VH(LF)(SN): Power Connector Brand: JST Sales America Inc. <https://www.jst.com/> Series: VH <http://www.digikey.com/product-search/en?FV=fff40016,fff802f3,ffec0e9d> Distributor: Digi-Key <http://www.digikey.com/product-detail/en/B2PS-VH%28LF%29%28SN%29/455-1648-ND/926555>; DIGIKEY: 455-1648-ND; MPN: B2PS-VH(LF)(SN)
J2 = RoboJackets-Connectors:HFW8; DIGIKEY: 609-1788-1-ND; MPN: HFW8R-1STE1LF
J5 = RoboJackets-Connectors:2-PIN_2MM-*; PINS: 2; PIN_PITCH: 2.0 mm
J6 = RoboJackets-Connectors:3-PIN_2MM-*; PINS: 3; PIN_PITCH: 2.0 mm
J7-J9 = RoboJackets-Connectors:CONN-2
L1 = RoboJackets-Inductors:GA34XX-BL
Q1 = RoboJackets-Discrete:ATP302
Q2 = RoboJackets-Discrete:IRFS4227
Q3-Q6 = RoboJackets-Discrete:BSS127
Q7 = RoboJackets-Discrete:AOD1N60
Q10 = RoboJackets-Discrete:BSS806N
R1 R2 R9-R18 = resistor:R-US_: RESISTOR, American symbol
R3-R8 R19-R25 R27 R29-R37 R39-R43 R46-R55 = rcl:R-US_: RESISTOR, American symbol
R26 R28 R44 R45 = rcl:R-US_: RESISTOR, American symbol; SPICEPREFIX: R
R38 = RoboJackets-Resistors:PWR263S-35
S1 = RoboJackets-Switches:CSS-121XB
S2-S4 = RoboJackets-Switches:HDP001?
U1 = RoboJackets-PowerICs:R-78E5.0-0.5
U2 = RoboJackets-PowerICs:MIC5235YM5
U3 = RoboJackets-ICs:LT3751
U4 = RoboJackets-ICs:AT32A
U5 = RoboJackets-PowerICs:IX4427
U6 U7 = RoboJackets-ICs:MAX6817
U$6 U$7 = RoboJackets-Discrete:IXGK400N30A3
XF1 = RoboJackets-Fuses:3557-2; DIGIKEY: 36-3557-2-ND; MPN: 3557-2